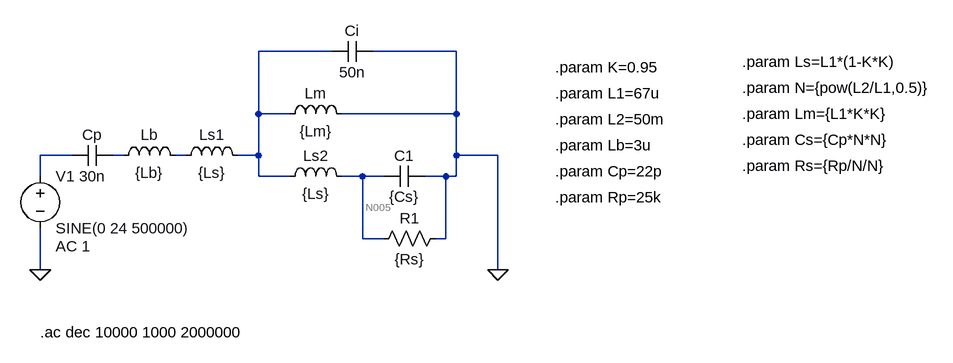
[diagram p0: schematic Draft2.asc]
Draft2.asc, the LTspice schematic file:
Version 4
SHEET 1 1388 680
WIRE 416 -48 304 -48
WIRE 608 -48 480 -48
WIRE 304 48 304 -48
WIRE 352 48 304 48
WIRE 608 48 608 -48
WIRE 608 48 432 48
WIRE 16 112 -32 112
WIRE 96 112 80 112
WIRE 192 112 176 112
WIRE 304 112 304 48
WIRE 304 112 272 112
WIRE 608 112 608 48
WIRE 672 112 608 112
WIRE -32 144 -32 112
WIRE 304 144 304 112
WIRE 352 144 304 144
WIRE 464 144 432 144
WIRE 496 144 464 144
WIRE 592 144 560 144
WIRE 608 144 608 112
WIRE 608 144 592 144
WIRE 464 240 464 144
WIRE 496 240 464 240
WIRE 592 240 592 144
WIRE 592 240 576 240
WIRE -32 288 -32 224
WIRE 672 288 672 112
FLAG 672 288 0
FLAG -32 288 0
SYMBOL cap 80 96 R90
WINDOW 0 0 32 VBottom 2
WINDOW 3 32 32 VTop 2
SYMATTR InstName Cp
SYMATTR Value 30n
SYMBOL ind 176 128 R270
WINDOW 0 32 56 VTop 2
WINDOW 3 5 56 VBottom 2
SYMATTR InstName Ls1
SYMATTR Value {Ls}
SYMBOL ind 336 64 R270
WINDOW 0 32 56 VTop 2
WINDOW 3 5 56 VBottom 2
SYMATTR InstName Lm
SYMATTR Value {Lm}
SYMBOL ind 336 160 R270
WINDOW 0 32 56 VTop 2
WINDOW 3 5 56 VBottom 2
SYMATTR InstName Ls2
SYMATTR Value {Ls}
SYMBOL cap 560 128 R90
WINDOW 0 0 32 VBottom 2
WINDOW 3 32 32 VTop 2
SYMATTR InstName C1
SYMATTR Value {Cs}
SYMBOL voltage -32 128 R0
WINDOW 123 24 124 Left 2
WINDOW 39 0 0 Left 0
SYMATTR Value2 AC 1
SYMATTR InstName V1
SYMATTR Value SINE(0 24 500000)
SYMBOL ind 80 128 R270
WINDOW 0 32 56 VTop 2
WINDOW 3 5 56 VBottom 2
SYMATTR InstName Lb
SYMATTR Value {Lb}
SYMBOL res 592 224 R90
WINDOW 0 0 56 VBottom 2
WINDOW 3 32 56 VTop 2
SYMATTR InstName R1
SYMATTR Value {Rs}
SYMBOL cap 480 -64 R90
WINDOW 0 0 32 VBottom 2
WINDOW 3 32 32 VTop 2
SYMATTR InstName Ci
SYMATTR Value 50n
TEXT -32 384 Left 2 !.ac dec 10000 1000 2000000
TEXT 760 -24 Left 2 !.param K=0.95
TEXT 760 16 Left 2 !.param L1=67u
TEXT 760 56 Left 2 !.param L2=50m
TEXT 760 96 Left 2 !.param Lb=3u
TEXT 1048 -32 Left 2 !.param Ls=L1*(1-K*K)
TEXT 1048 8 Left 2 !.param N={pow(L2/L1,0.5)}
TEXT 760 136 Left 2 !.param Cp=22p
TEXT 1048 48 Left 2 !.param Lm={L1*K*K}
TEXT 1048 88 Left 2 !.param Cs={Cp*N*N}
TEXT 760 176 Left 2 !.param Rp=25k
TEXT 1048 128 Left 2 !.param Rs={Rp/N/N}

The netlist it stands for:
* Draft2.asc
Cp N003 N002 30n
Ls1 N004 N001 {Ls}
Lm N001 0 {Lm}
Ls2 N001 N005 {Ls}
C1 0 N005 {Cs}
V1 N002 0 SINE(0 24 500000) AC 1
Lb N003 N004 {Lb}
R1 0 N005 {Rs}
Ci 0 N001 50n
.ac dec 10000 1000 2000000
.param K=0.95
.param L1=67u
.param L2=50m
.param Lb=3u
.param Ls=L1*(1-K*K)
.param N={pow(L2/L1,0.5)}
.param Cp=22p
.param Lm={L1*K*K}
.param Cs={Cp*N*N}
.param Rp=25k
.param Rs={Rp/N/N}
.backanno
.end

* Results of the author's LTspice run, read from the files saved beside the schematic
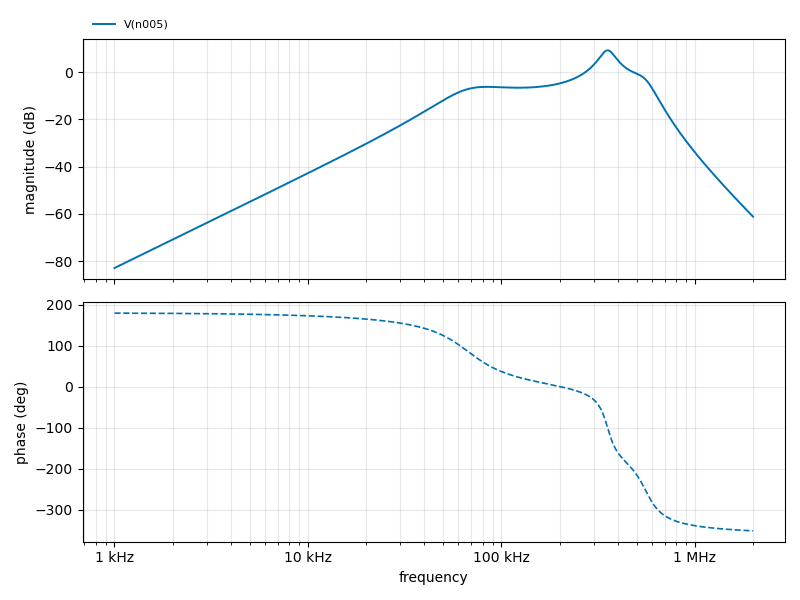
[diagram p1: AC Analysis of Draft2.asc, plotted from the saved traces]
* AC Analysis, 1 run:
*   V(n005): -82.90 dB at 1 kHz, -61.17 dB at 2 MHz, peak 9.24 dB at 354 kHz, 3 dB below the peak at 322.8 kHz and 388.9 kHz